# Altium schematic sheet Mach_IO.SchDoc
size A3; SheetNumber: 1; SheetTotal: 9
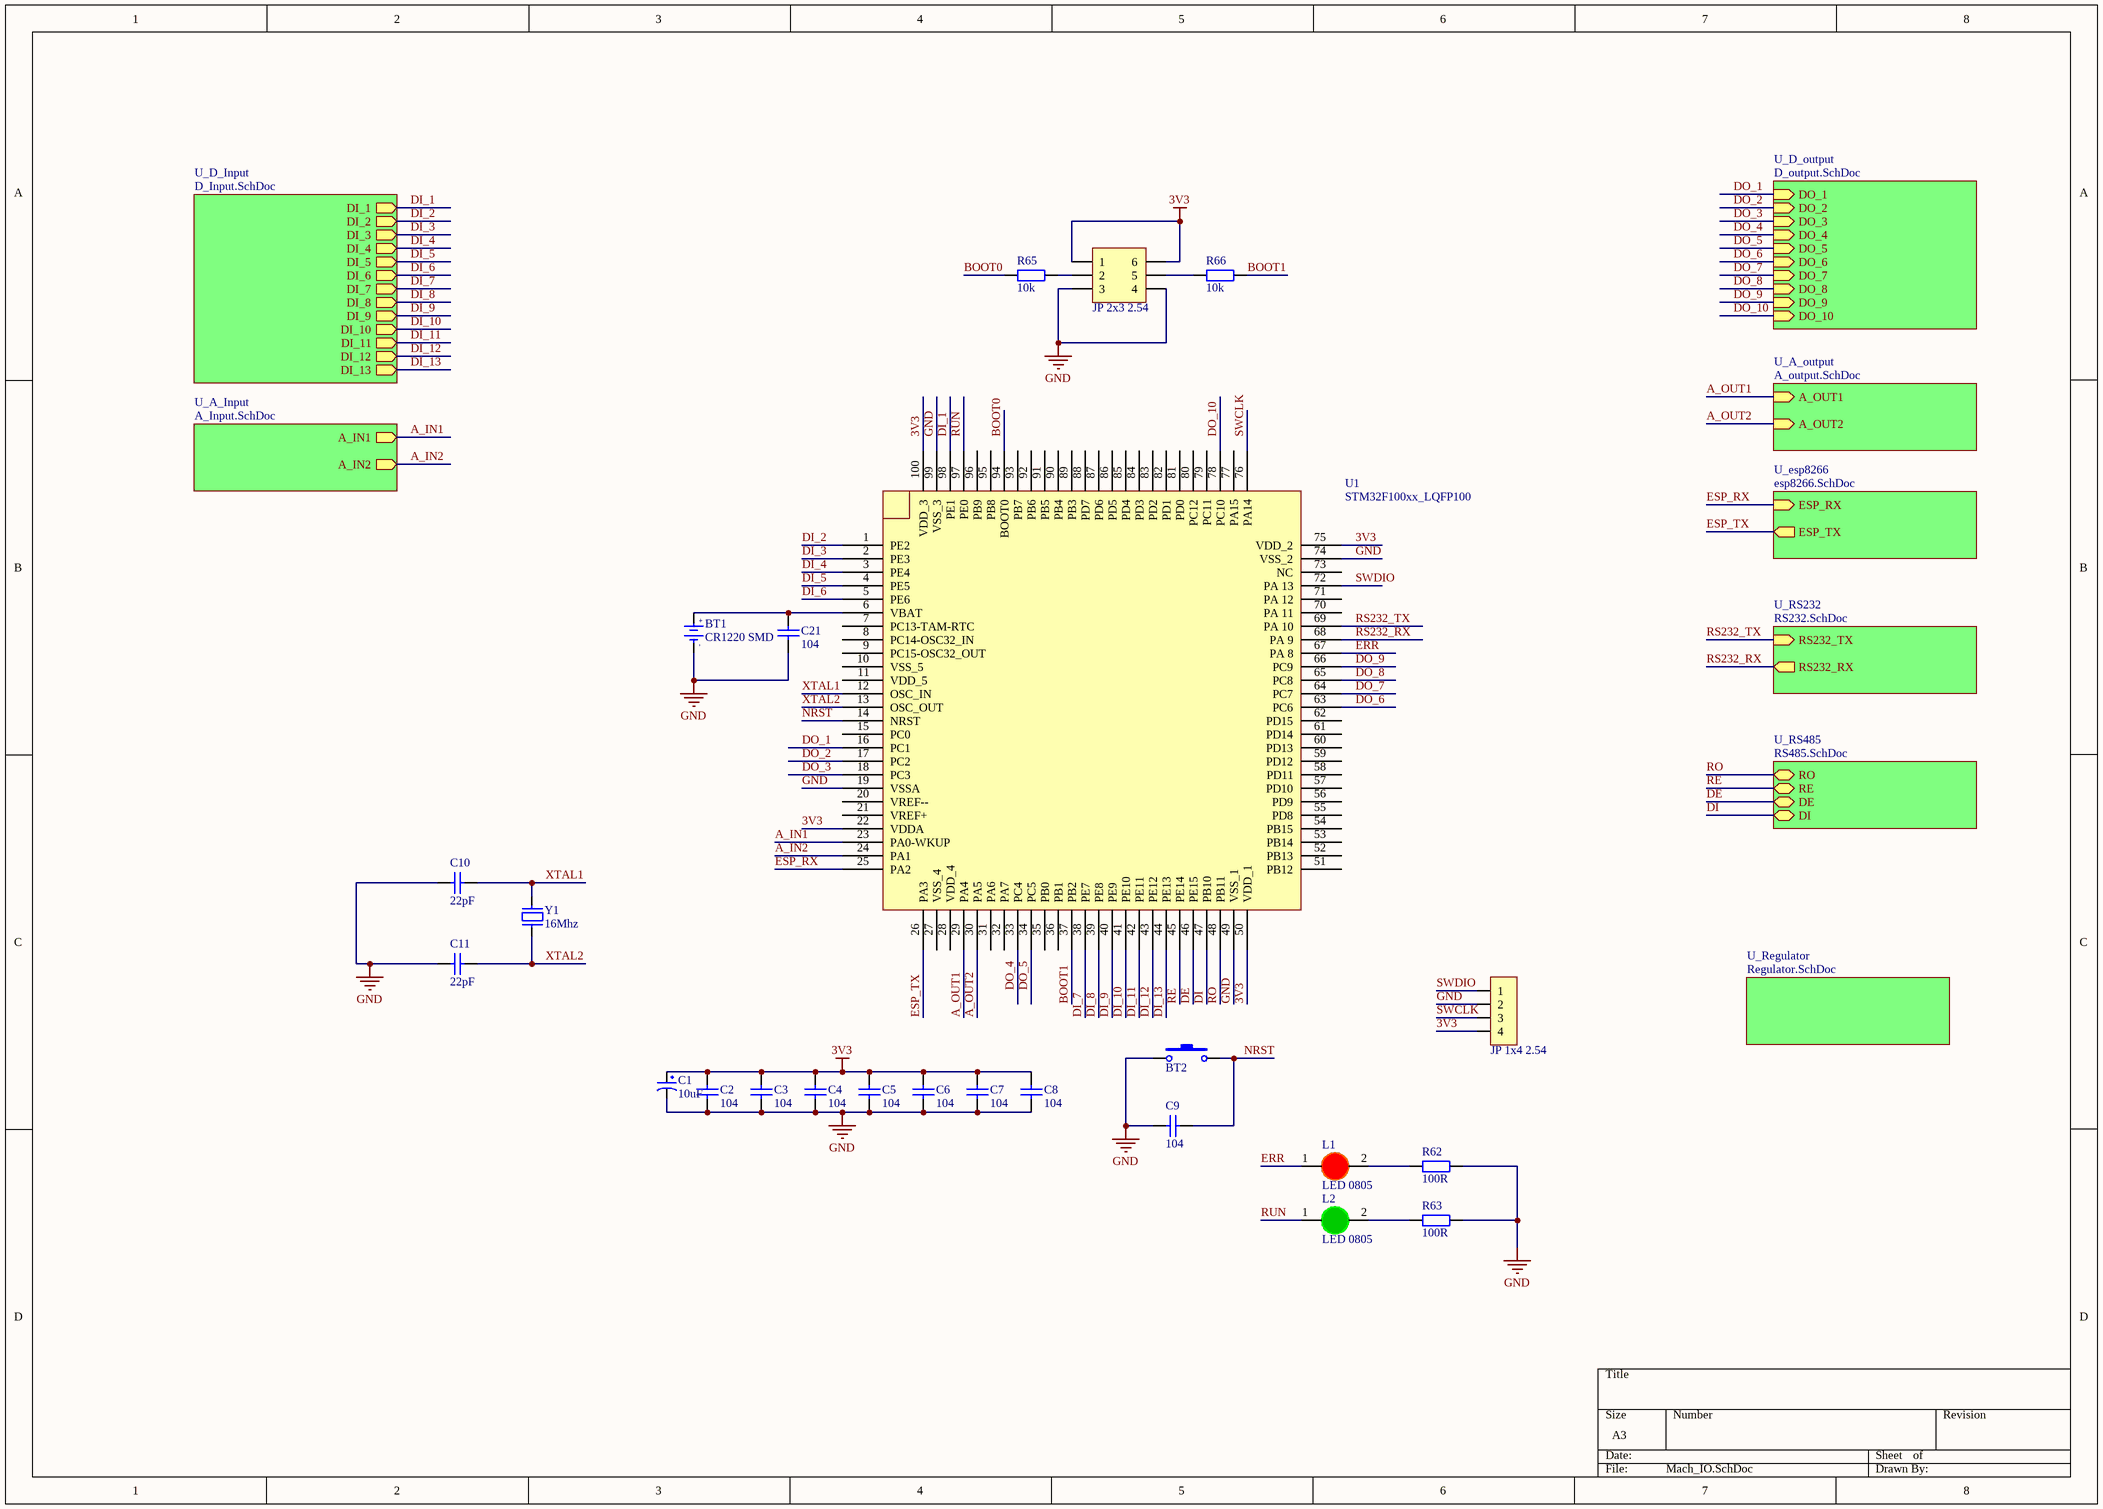
[diagram p0: Mach_IO.SchDoc]

## Parts
BT1  CR1220 SMD  [DE PIN CR1220]
BT2  Nut Nhan 2 Chan SMD 3x6x2.5  [Nut Nhan 2 Chan SMD 3x6x2.5]  (value not drawn)
C1  10uF  [tu tantalum smd3216]
C2  104  [tu 0805]
C3  104  [tu 0805]
C4  104  [tu 0805]
C5  104  [tu 0805]
C6  104  [tu 0805]
C7  104  [tu 0805]
C8  104  [tu 0805]
C9  104  [tu 0805]
C10  22pF  [tu 0805]
C11  22pF  [tu 0805]
C21  104  [tu 0805]
JP2  JP 2x3 2.54  [JP 2x3 DT]
JP10  JP 1x4 2.54  [JP 1x4 DT]
L1  LED 0805  [LED-0805-Red]
L2  LED 0805  [LED-0805-Green]
R62  100R  [tro smd 0805]
R63  100R  [tro smd 0805]
R65  10k  [tro smd 0805]
R66  10k  [tro smd 0805]
U1  STM32F100xx_LQFP100  [STM32_LQFP100]
Y1  16Mhz  [Thach Anh 2 chan cam]

## Sub-sheets
U_A_Input = A_Input.SchDoc: A_IN1 (out), A_IN2 (out)
U_A_output = A_output.SchDoc: A_OUT1 (in), A_OUT2 (in)
U_D_Input = D_Input.SchDoc: DI_1 (out), DI_2 (out), DI_3 (out), DI_4 (out), DI_5 (out), DI_6 (out), DI_7 (out), DI_8 (out), DI_9 (out), DI_10 (out), DI_11 (out), DI_12 (out), DI_13 (out)
U_D_output = D_output.SchDoc: DO_1 (in), DO_2 (in), DO_3 (in), DO_4 (in), DO_5 (in), DO_6 (in), DO_7 (in), DO_8 (in), DO_9 (in), DO_10 (in)
U_esp8266 = esp8266.SchDoc: ESP_TX (out), ESP_RX (in)
U_Regulator = Regulator.SchDoc: no entries
U_RS232 = RS232.SchDoc: RS232_RX (out), RS232_TX (in)
U_RS485 = RS485.SchDoc: RO (bidir), RE (bidir), DE (bidir), DI (bidir)

## Nets
3V3: C1.1 C2.1 C3.1 C4.1 C5.1 C6.1 C7.1 C8.1 JP2.1 JP2.6 JP10.4 U1.22(VDDA) U1.50(VDD_1) U1.75(VDD_2) U1.100(VDD_3)
GND: BT1.2(GND) BT2.1 C1.2 C2.2 C3.2 C4.2 C5.2 C6.2 C7.2 C8.2 C9.1 C10.2 C11.2 C21.1 JP2.3 JP2.4 JP10.2 R62.2 R63.2 U1.19(VSSA) U1.49(VSS_1) U1.74(VSS_2) U1.99(VSS_3)
A_IN1: U1.23(PA0-WKUP) ; sheet U_A_Input/A_IN1
A_IN2: U1.24(PA1) ; sheet U_A_Input/A_IN2
A_OUT1: U1.29(PA4) ; sheet U_A_output/A_OUT1
A_OUT2: U1.30(PA5) ; sheet U_A_output/A_OUT2
BOOT0: R65.1 U1.94(BOOT0)
BOOT1: R66.2 U1.37(PB2)
DE: U1.46(PE15) ; sheet U_RS485/DE
DI: U1.47(PB10) ; sheet U_RS485/DI
DI_1: U1.98(PE1) ; sheet U_D_Input/DI_1
DI_2: U1.1(PE2) ; sheet U_D_Input/DI_2
DI_3: U1.2(PE3) ; sheet U_D_Input/DI_3
DI_4: U1.3(PE4) ; sheet U_D_Input/DI_4
DI_5: U1.4(PE5) ; sheet U_D_Input/DI_5
DI_6: U1.5(PE6) ; sheet U_D_Input/DI_6
DI_7: U1.38(PE7) ; sheet U_D_Input/DI_7
DI_8: U1.39(PE8) ; sheet U_D_Input/DI_8
DI_9: U1.40(PE9) ; sheet U_D_Input/DI_9
DI_10: U1.41(PE10) ; sheet U_D_Input/DI_10
DI_11: U1.42(PE11) ; sheet U_D_Input/DI_11
DI_12: U1.43(PE12) ; sheet U_D_Input/DI_12
DI_13: U1.44(PE13) ; sheet U_D_Input/DI_13
DO_1: U1.16(PC1) ; sheet U_D_output/DO_1
DO_2: U1.17(PC2) ; sheet U_D_output/DO_2
DO_3: U1.18(PC3) ; sheet U_D_output/DO_3
DO_4: U1.33(PC4) ; sheet U_D_output/DO_4
DO_5: U1.34(PC5) ; sheet U_D_output/DO_5
DO_6: U1.63(PC6) ; sheet U_D_output/DO_6
DO_7: U1.64(PC7) ; sheet U_D_output/DO_7
DO_8: U1.65(PC8) ; sheet U_D_output/DO_8
DO_9: U1.66(PC9) ; sheet U_D_output/DO_9
DO_10: U1.78(PC10) ; sheet U_D_output/DO_10
ERR: L1.1(A) U1.67(PA_8)
ESP_RX: U1.25(PA2) ; sheet U_esp8266/ESP_RX
ESP_TX: U1.26(PA3) ; sheet U_esp8266/ESP_TX
NRST: BT2.2 C9.2 U1.14(NRST)
RE: U1.45(PE14) ; sheet U_RS485/RE
RO: U1.48(PB11) ; sheet U_RS485/RO
RS232_RX: U1.68(PA_9) ; sheet U_RS232/RS232_RX
RS232_TX: U1.69(PA_10) ; sheet U_RS232/RS232_TX
RUN: L2.1(A) U1.97(PE0)
SWCLK: JP10.3 U1.76(PA14)
SWDIO: JP10.1 U1.72(PA_13)
XTAL1: C10.1 U1.12(OSC_IN) Y1.2
XTAL2: C11.1 U1.13(OSC_OUT) Y1.1
NetBT1_1: BT1.1(+3V) C21.2 U1.6(VBAT)
NetJP2_2: JP2.2 R65.2
NetJP2_5: JP2.5 R66.1
NetL1_2: L1.2(K) R62.1
NetL2_2: L2.2(K) R63.1

Not connected (* = marked no-connect by the designer): U1 7(PC13-TAM-RTC) 8(PC14-OSC32_IN) 9(PC15-OSC32_OUT) 10(VSS_5) 11(VDD_5) 15(PC0) 20(VREF--) 21(VREF+) 27(VSS_4) 28(VDD_4) 31(PA6) 32(PA7) 35(PB0) 36(PB1) 51(PB12) 52(PB13) 53(PB14) 54(PB15) 55(PD8) 56(PD9) 57(PD10) 58(PD11) 59(PD12) 60(PD13) 61(PD14) 62(PD15) 70(PA_11) 71(PA_12) 73(NC) 77(PA15) 79(PC11) 80(PC12) 81(PD0) 82(PD1) 83(PD2) 84(PD3) 85(PD4) 86(PD5) 87(PD6) 88(PD7) 89(PB3) 90(PB4) 91(PB5) 92(PB6) 93(PB7) 95(PB8) 96(PB9)

## Notes on the sheet
- (in symbol De pin CR1220 SMD) +; -

## Library data of the parts
BT1 = De pin CR1220 SMD: Ten: Đế PIN CR1220 SMD; Ma_Hang: MH000833
BT2 = Nut Nhan 2 Chan SMD 3x6x2.5: Ma_Hang: MH001036; Ten: Nút Nhấn 2 Chân 3x6x2.5MM SMD
C1 = Tu tantalum 10uF 16V SMD3216: Dán; Don_Vi: Con; So_Chan: 2; Ten_Linh_Kien: Tụ tantalum 106C-10uF 16V SMD3216; Ma_Hang: MH001954; Chung_Loai: Dán; Kieu_Chan: *
C2-C9 C21 = Tu 0805 104 50V 10%: Dán; Don_Vi: Con; So_Chan: 2; Ten_Linh_Kien: Tụ 0805 104-100nF 10% 50V; Ma_Hang: MH004551; Chung_Loai: Dán; Kieu_Chan: *
C10 C11 = Tu 0805 22pF 50V 10%: Dán; Don_Vi: Con; So_Chan: 2; Ten_Linh_Kien: Tụ 0805 22P 10% 50V; Ma_Hang: MH004560; Chung_Loai: Dán; Kieu_Chan: *
JP2 = JP 2x3 2.54 Duc Thang: Cắm; Ten_Linh_Kien: Jump Đôi Đực 2.54MM 2x40P Thẳng 11MM; Don_Vi: Con; Ma_Hang: MH002686; Ghi_Chu: *; Kieu_Chan: *; Chung_Loai: Cắm
JP10 = JP 1x4 2.54 Duc Thang: Cắm; Ten_Linh_Kien: Jump Đơn Đực 2.54MM 1x40P Thẳng 11MM; Don_Vi: Con; Ma_Hang: MH000903; Ghi_Chu: *; Kieu_Chan: *; Chung_Loai: Cắm
L1 = LED 0805 Do: Dán; Don_Vi: Con; Ma_Hang: MH000897; Ten_Linh_Kien: LED 0805 Màu Đỏ (Red); Ghi_Chu: *; Kieu_Chan: *; Chung_Loai: Dán
L2 = LED 0805 Xanh La: Dán; Don_Vi: Con; Ma_Hang: MH002326; Ten_Linh_Kien: LED 0805 Màu Xanh Lá (Green); Ghi_Chu: *; Kieu_Chan: *; Chung_Loai: Dán
R62 R63 = Tro 0805 5% 100R: Dán; Don_Vi: Con; So_Chan: 2; Ten_Linh_Kien: Trở 0805 5% 100R; Ma_Hang: MH005251; Chung_Loai: Dán; Kieu_Chan: *
R65 R66 = Tro 0805 1% 10k: Dán; Don_Vi: Con; So_Chan: 2; Ten_Linh_Kien: Trở 0805 1% 10k; Ma_Hang: MH005473; Chung_Loai: Dán; Kieu_Chan: *
Y1 = Thach Anh 2 chan Cam: Crystal For all Crystal 2pin.; Value: 4Mhz